# Altium schematic sheet Interfacing.SchDoc
size A4; SheetNumber: 4; SheetTotal: 5
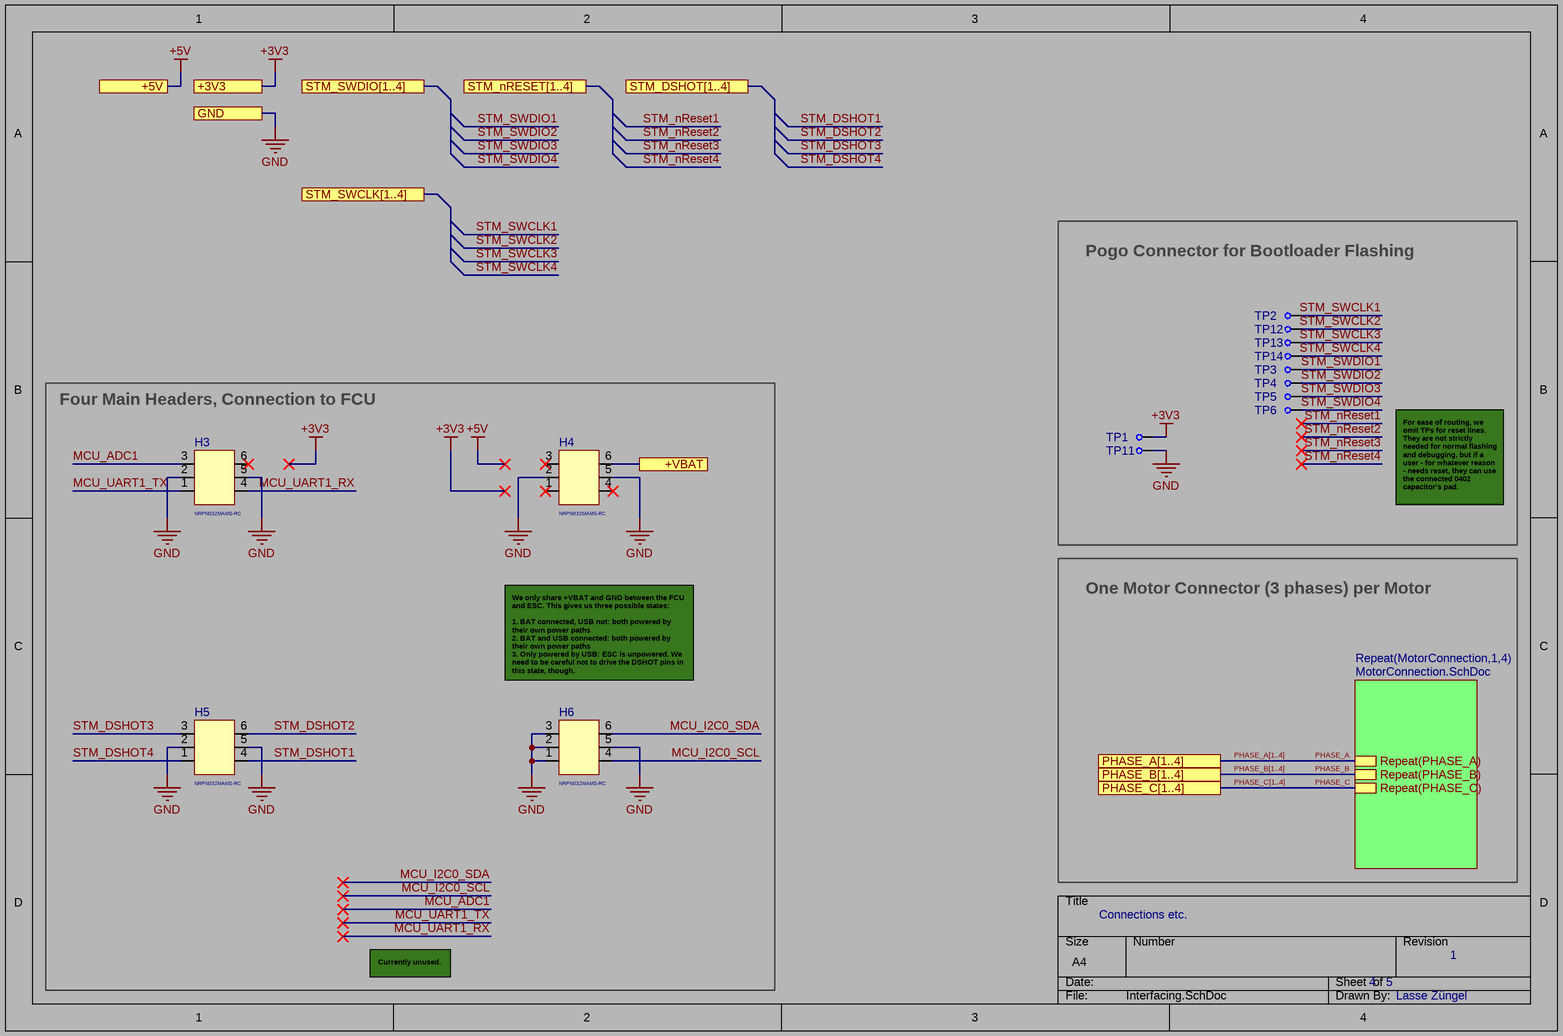
[diagram p0: Interfacing.SchDoc]

## Parts
H3  NRPN032MAMS-RC  [NRPN032MAMS-RC]
H4  NRPN032MAMS-RC  [NRPN032MAMS-RC]
H5  NRPN032MAMS-RC  [NRPN032MAMS-RC]
H6  NRPN032MAMS-RC  [NRPN032MAMS-RC]
TP1  TestPoint  [TestPoint]  (value not drawn)
TP2  TestPoint  [TestPoint]  (value not drawn)
TP3  TestPoint  [TestPoint]  (value not drawn)
TP4  TestPoint  [TestPoint]  (value not drawn)
TP5  TestPoint  [TestPoint]  (value not drawn)
TP6  TestPoint  [TestPoint]  (value not drawn)
TP11  TestPoint  [TestPoint]  (value not drawn)
TP12  TestPoint  [TestPoint]  (value not drawn)
TP13  TestPoint  [TestPoint]  (value not drawn)
TP14  TestPoint  [TestPoint]  (value not drawn)

## Blocks framed on the sheet
Pogo Connector for Bootloader Flashing: TP1-TP6 TP11-TP14
Four Main Headers, Connection to FCU: H3-H6

## Sub-sheets
Repeat(MotorConnection,1,4) = MotorConnection.SchDoc: Repeat(PHASE_A), Repeat(PHASE_B), Repeat(PHASE_C)

## Ports
+3V3 (see Main[3B], MotorDriverChannel[2C], Power[1B]), +5V (see Main[3C], MotorDriverChannel[2C], Power[1B]), +VBAT (see Main[3C], MotorDriverChannel[2C], Power[1B]), GND (see Main[3C], MotorDriverChannel[2C], Power[1B]), PHASE_A[1..4] (see Main[3C]), PHASE_B[1..4] (see Main[3C]), PHASE_C[1..4] (see Main[3C]), STM_DSHOT[1..4] (see Main[3C]), STM_nRESET[1..4] (see Main[3C]), STM_SWCLK[1..4] (see Main[3C]), STM_SWDIO[1..4] (see Main[3C])

## Nets
+3V3: TP1.1 ; port +3V3
+5V: port +5V
GND: H3.2 H3.5 H4.2 H4.5 H5.2 H5.5 H6.1 H6.2 H6.3 H6.5 TP11.1 ; port GND
+VBAT: H4.6 ; port +VBAT
MCU_ADC1: H3.3
MCU_I2C0_SCL: H6.4
MCU_I2C0_SDA: H6.6
MCU_UART1_RX: H3.4
MCU_UART1_TX: H3.1
PHASE_A: sheet Repeat(MotorConnection,1,4)/Repeat(PHASE_A)
PHASE_B: sheet Repeat(MotorConnection,1,4)/Repeat(PHASE_B)
PHASE_C: sheet Repeat(MotorConnection,1,4)/Repeat(PHASE_C)
STM_DSHOT1: H5.4
STM_DSHOT2: H5.6
STM_DSHOT3: H5.3
STM_DSHOT4: H5.1
STM_SWCLK1: TP2.1
STM_SWCLK2: TP12.1
STM_SWCLK3: TP13.1
STM_SWCLK4: TP14.1
STM_SWDIO1: TP3.1
STM_SWDIO2: TP4.1
STM_SWDIO3: TP5.1
STM_SWDIO4: TP6.1

Not connected (* = marked no-connect by the designer): H3 6*; H4 1* 3* 4*

## Buses and harness runs
bus PHASE_A[1..4] = port PHASE_A[1..4]
bus PHASE_B[1..4] = port PHASE_B[1..4]
bus PHASE_C[1..4] = port PHASE_C[1..4]

## Notes on the sheet
- For ease of routing, we omit TPs for reset lines. They are not strictly needed for normal flashing and debugging, but if a user - for whatever reason - needs reset, they can use the connected 0402 capacitor's pad.
- One Motor Connector (3 phases) per Motor
- We only share +VBAT and GND between the FCU and ESC. This gives us three possible states:
  1. BAT connected, USB not: both powered by their own power paths
  2. BAT and USB connected: both powered by their own power paths
  3. Only powered by USB: ESC is unpowered. We need to be careful not to drive the DSHOT pins in this state, though.
- Connections etc.
- Currently unused.
- 4   5
- 1
- Lasse Züngel

## Library data of the parts
H3-H6 = NRPN032MAMS-RC: CONN HEADER SMD 6POS 2MM
TP1-TP6 TP11-TP14 = TestPoint: High density testpoint, diameter 0.7mm (very small)